# Altium schematic sheet 100_AC-DC.SchDoc: AC-DC Convertion Stages
size A4; Date: XXXXXX; DrawnBy: C.A.Cuaspa; Revision: V1R0; SheetNumber: 2; SheetTotal: 3
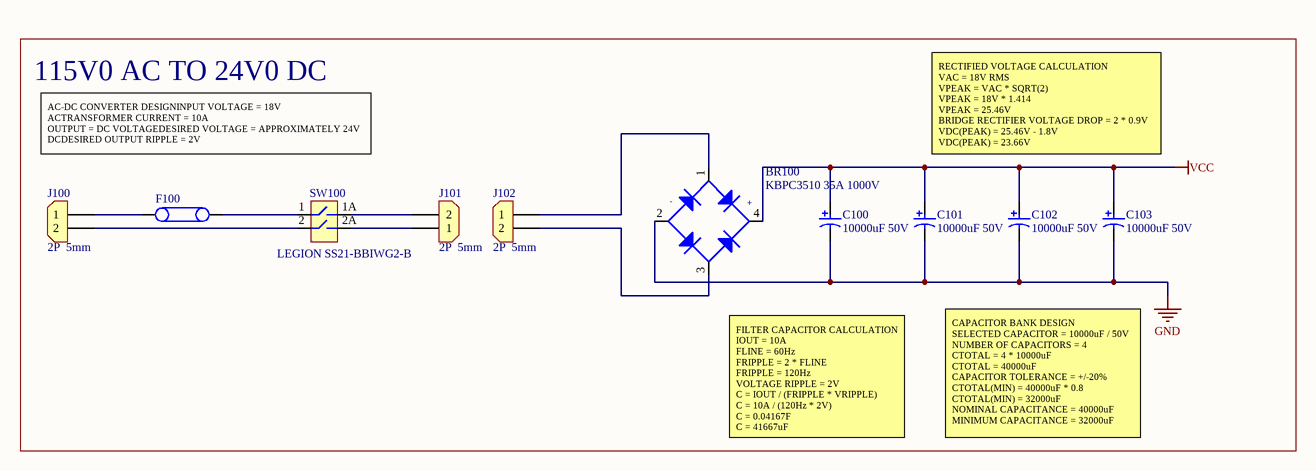
[diagram p0: 100_AC-DC.SchDoc]

## Parts
BR100  KBPC3510 35A 1000V  [BR_KBPC3510]
C100  10000uF 50V  [Cap_10000uF_50V]
C101  10000uF 50V  [Cap_10000uF_50V]
C102  10000uF 50V  [Cap_10000uF_50V]
C103  10000uF 50V  [Cap_10000uF_50V]
F100  500V 10A  [FUSE_HLD_CARTRIDGE_5x20mm]  (value not drawn)
J100  2P  5mm  [CON_2x1_TH_5mm]
J101  2P  5mm  [CON_2x1_TH_5mm]
J102  2P  5mm  [CON_2x1_TH_5mm]
SW100  LEGION SS21-BBIWG2-B  [SW_DPST_12A_250V]

## Blocks framed on the sheet
115V0 AC TO 24V0 DC: BR100 C100-C103 F100 J100-J102 SW100

## Nets
GND: BR100.2 C100.2 C101.2 C102.2 C103.2
VCC: BR100.4 C100.1 C101.1 C102.1 C103.1
NetBR100_1: BR100.1 J102.1
NetBR100_3: BR100.3 J102.2
NetF100_1: F100.1 J100.1
NetF100_2: F100.2 SW100.1
NetJ100_2: J100.2 SW100.2
NetJ101_1: J101.1 SW100.2A
NetJ101_2: J101.2 SW100.1A

## Notes on the sheet
- AC-DC CONVERTER DESIGNINPUT VOLTAGE = 18V ACTRANSFORMER CURRENT = 10A
  OUTPUT = DC VOLTAGEDESIRED VOLTAGE = APPROXIMATELY 24V DCDESIRED OUTPUT RIPPLE = 2V
- RECTIFIED VOLTAGE CALCULATION
  VAC = 18V RMS
  VPEAK = VAC * SQRT(2)
  VPEAK = 18V * 1.414
  VPEAK = 25.46V
  BRIDGE RECTIFIER VOLTAGE DROP = 2 * 0.9V
  VDC(PEAK) = 25.46V - 1.8V
  VDC(PEAK) = 23.66V
- FILTER CAPACITOR CALCULATION
  IOUT = 10A
  FLINE = 60Hz
  FRIPPLE = 2 * FLINE
  FRIPPLE = 120Hz
  VOLTAGE RIPPLE = 2V
  C = IOUT / (FRIPPLE * VRIPPLE)
  C = 10A / (120Hz * 2V)
  C = 0.04167F
  C = 41667uF
  REQUIRED NOMINAL CAPACITANCE = 41667uF
- CAPACITOR BANK DESIGN
  SELECTED CAPACITOR = 10000uF / 50V
  NUMBER OF CAPACITORS = 4
  CTOTAL = 4 * 10000uF
  CTOTAL = 40000uF
  CAPACITOR TOLERANCE = +/-20%
  CTOTAL(MIN) = 40000uF * 0.8
  CTOTAL(MIN) = 32000uF
  NOMINAL CAPACITANCE = 40000uF
  MINIMUM CAPACITANCE = 32000uF
- Title:
- Project:
- File:
- Revision:
- Date:
- Size:
- A4
- Drawn by:
- (in symbol BR_KBPC3510) -; +

## Library data of the parts
BR100 = BR_KBPC3510: BRIDGE RECT 1kV 35A KBPC-25; Manufacturer: MDD(Microdiode Semiconductor); Manufacturer Part Number: KBPC3510; Supplier 1: LCSC; Supplier Part Number 1: C26346; Reel Stock: N/A; Last modified by: C.A.Cuaspa; Last modified date: 20261106; ComponentLink2Description: LCSC; ComponentLink2URL: https://www.lcsc.com/es/product-detail/C26346.html?s_z=s_p_KBPC3510; ComponentLink3Description: DATASHEET; ComponentLink3URL: https://www.lcsc.com/datasheet/C26346.pdf
C100-C103 = Cap_10000uF_50V: ALUMINUM ELECTROLYTIC CAPACITOR 10000uF 50V; Manufacturer: Nichicon; Manufacturer Part Number: LGU1H103MELC; Reel stock: N/A; Last modified by: C.A.Cuaspa; Last modified date: 20261106; Supplier 1: LCSC; Supplier Part Number 1: C507612; ComponentLink1Description: LCSC; ComponentLink1URL: https://www.lcsc.com/es/product-detail/C507612.html?s_z=n_q_LGU1H103MELC&spm=wm.fly.bg.0.xh&lcsc_vid=EwUMXgBWR1lcUFdRQFRcAwFUEQILBlJUQ1JZBFRfRAMxVlNfRFhXVVNSRFJbUTsOAxUeFF5JWBYZEEoKFBINSQcJGk4LFEs%3D; ComponentLink2Description: DATASHEET; ComponentLink2URL: https://www.lcsc.com/datasheet/C507612.pdf?spm=wm.sxq.inf.ggs___wm.fly.bg.0.xh&lcsc_vid=EwUMXgBWR1lcUFdRQFRcAwFUEQILBlJUQ1JZBFRfRAMxVlNfRFhXVVNSRFJbUTsOAxUeFF5JWBYZEEoKFBINSQcJGk4LFEs%3D; Value: 10000uF 50V
F100 = F_HLD_CARTRIDGE_5x20mm: FUSE BLOK CARTRIDGE 500V 10A PCB; Manufacturer: Schurter Inc.; Manufacturer Part Number: 0031.8201; Supplier 1: Digi-Key; Supplier Part Number 1: 486-1258-ND; Reel Sotck: N/A; Last modified by: J.Jaramillo; Last modified date: 20240309; ComponentLink1Description: Digi-Key; ComponentLink1URL: https://www.digikey.com/en/products/detail/schurter-inc/0031-8201/669925?s=N4IgTCBcDaIAxwMwEYB0AOMdkgLoF8g
J100-J102 = Con_2x1_TH_5mm: TERM BLK 2POS SIDE ENTRY 5MM PCB; Manufacturer: Phoenix Contact; Manufacturer Part Number: 1935161; Supplier Part Number 1: 277-1667-ND; Last modified by: J.Jaramillo; Last modified date: 20240310; ComponentLink1Description: Digi-key; ComponentLink1URL: https://www.digikey.com/en/products/detail/phoenix-contact/1935161/568614; Reel Stock: N/A; Supplier 1: Digi-Key
SW100 = SW_DPST_12A_250V: SWITCH ROCKER DPST 12A 250V; Manufacturer: Legion; Manufacturer Part Number: SS21-BBIWG2-B; Supplier 1: LCSC; Supplier Part Number 1: C6775929; Reel Stock: N/A; Last modified by: C.A.Cuaspa; Last modified date: 20261106; ComponentLink2Description: LCSC; ComponentLink2URL: https://www.lcsc.com/es/product-detail/C6775929.html?s_z=n_q_SS21-BBIWG2-B&spm=wm.fly.bg.0.cbh&lcsc_vid=EwUMXgBWR1lcUFdRQFRcAwFUEQILBlJUQ1JZBFRfRAMxVlNfRFhXV1ZQRFlXUDsOAxUeFF5JWBYZEEoKFBINSQcJGk4LFEs%3D; ComponentLink3Description: DATASHEET; ComponentLink3URL: https://www.lcsc.com/datasheet/C6775929.pdf?spm=wm.sxq.inf.ggs___wm.fly.bg.0.cbh&lcsc_vid=EwUMXgBWR1lcUFdRQFRcAwFUEQILBlJUQ1JZBFRfRAMxVlNfRFhXV1ZQRFlXUDsOAxUeFF5JWBYZEEoKFBINSQcJGk4LFEs%3D